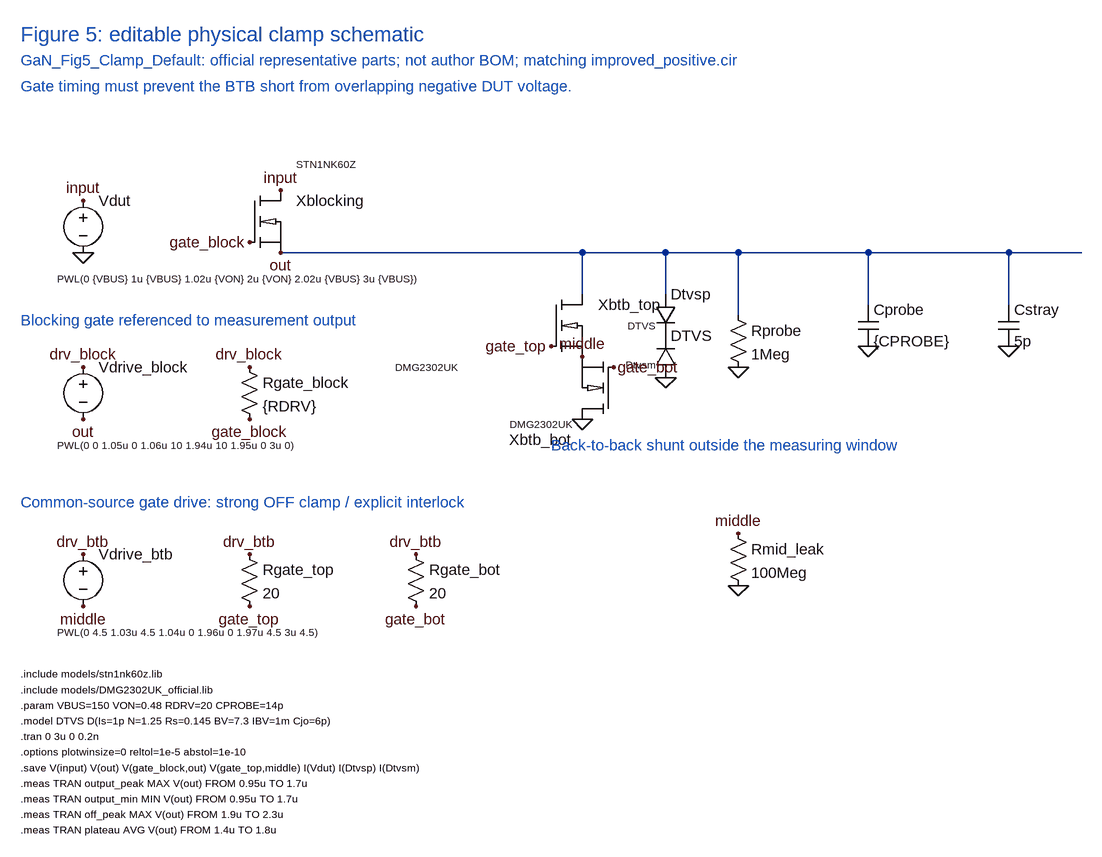
[diagram p0: schematic GaN_Fig5_Clamp_Default.asc]
GaN_Fig5_Clamp_Default.asc, the LTspice schematic file:
Version 4
SHEET 1 1880 1460
WIRE 1664 352 432 352
WIRE 896 416 896 352
WIRE 1024 416 1024 352
WIRE 1136 448 1136 352
WIRE 1336 432 1336 352
WIRE 1552 432 1552 352
FLAG 128 272 input
FLAG 128 352 0
FLAG 432 256 input
FLAG 384 336 gate_block
FLAG 432 352 out
FLAG 848 496 gate_top
FLAG 896 512 middle
FLAG 944 528 gate_bot
FLAG 896 608 0
FLAG 1024 544 0
FLAG 1136 528 0
FLAG 1336 496 0
FLAG 1552 496 0
FLAG 128 528 drv_block
FLAG 128 608 out
FLAG 384 528 drv_block
FLAG 384 608 gate_block
FLAG 128 816 drv_btb
FLAG 128 896 middle
FLAG 384 816 drv_btb
FLAG 384 896 gate_top
FLAG 640 816 drv_btb
FLAG 640 896 gate_bot
FLAG 1136 784 middle
FLAG 1136 864 0
SYMBOL voltage 128 256 R0
WINDOW 3 -40 136 Left 1
SYMATTR InstName Vdut
SYMATTR Value PWL(0 {VBUS} 1u {VBUS} 1.02u {VON} 2u {VON} 2.02u {VBUS} 3u {VBUS})
SYMBOL ClampBlockingSTN 384 256 R0
WINDOW 0 72 16 Left 2
WINDOW 3 72 -40 Left 1
SYMATTR InstName Xblocking
SYMATTR Value STN1NK60Z
SYMATTR Prefix X
SYMBOL ClampBTBDMG 848 416 R0
WINDOW 0 72 16 Left 2
WINDOW 3 -240 112 Left 1
SYMATTR InstName Xbtb_top
SYMATTR Value DMG2302UK
SYMATTR Prefix X
SYMBOL ClampBTBDMG 944 608 R180
WINDOW 0 64 -32 Left 2
WINDOW 3 64 -8 Left 1
SYMATTR InstName Xbtb_bot
SYMATTR Value DMG2302UK
SYMATTR Prefix X
SYMBOL diode 1008 416 R0
SYMATTR InstName Dtvsp
SYMATTR Value DTVS
SYMBOL diode 1040 544 R180
WINDOW 0 32 20 Left 1
WINDOW 3 32 80 Left 1
SYMATTR InstName Dtvsm
SYMATTR Value DTVS
SYMBOL res 1120 432 R0
SYMATTR InstName Rprobe
SYMATTR Value 1Meg
SYMBOL cap 1320 432 R0
SYMATTR InstName Cprobe
SYMATTR Value {CPROBE}
SYMBOL cap 1536 432 R0
SYMATTR InstName Cstray
SYMATTR Value 5p
SYMBOL voltage 128 512 R0
WINDOW 3 -40 136 Left 1
SYMATTR InstName Vdrive_block
SYMATTR Value PWL(0 0 1.05u 0 1.06u 10 1.94u 10 1.95u 0 3u 0)
SYMBOL res 368 512 R0
SYMATTR InstName Rgate_block
SYMATTR Value {RDRV}
SYMBOL voltage 128 800 R0
WINDOW 3 -40 136 Left 1
SYMATTR InstName Vdrive_btb
SYMATTR Value PWL(0 4.5 1.03u 4.5 1.04u 0 1.96u 0 1.97u 4.5 3u 4.5)
SYMBOL res 368 800 R0
SYMATTR InstName Rgate_top
SYMATTR Value 20
SYMBOL res 624 800 R0
SYMATTR InstName Rgate_bot
SYMATTR Value 20
SYMBOL res 1120 768 R0
SYMATTR InstName Rmid_leak
SYMATTR Value 100Meg
TEXT 32 16 Left 3 ;Figure 5: editable physical clamp schematic
TEXT 32 56 Left 2 ;GaN_Fig5_Clamp_Default: official representative parts; not author BOM; matching improved_positive.cir
TEXT 32 96 Left 2 ;Gate timing must prevent the BTB short from overlapping negative DUT voltage.
TEXT 848 648 Left 2 ;Back-to-back shunt outside the measuring window
TEXT 32 456 Left 2 ;Blocking gate referenced to measurement output
TEXT 32 736 Left 2 ;Common-source gate drive: strong OFF clamp / explicit interlock
TEXT 32 1000 Left 1 !.include models/stn1nk60z.lib
TEXT 32 1024 Left 1 !.include models/DMG2302UK_official.lib
TEXT 32 1048 Left 1 !.param VBUS=150 VON=0.48 RDRV=20 CPROBE=14p
TEXT 32 1072 Left 1 !.model DTVS D(Is=1p N=1.25 Rs=0.145 BV=7.3 IBV=1m Cjo=6p)
TEXT 32 1096 Left 1 !.tran 0 3u 0 0.2n
TEXT 32 1120 Left 1 !.options plotwinsize=0 reltol=1e-5 abstol=1e-10
TEXT 32 1144 Left 1 !.save V(input) V(out) V(gate_block,out) V(gate_top,middle) I(Vdut) I(Dtvsp) I(Dtvsm)
TEXT 32 1168 Left 1 !.meas TRAN output_peak MAX V(out) FROM 0.95u TO 1.7u
TEXT 32 1192 Left 1 !.meas TRAN output_min MIN V(out) FROM 0.95u TO 1.7u
TEXT 32 1216 Left 1 !.meas TRAN off_peak MAX V(out) FROM 1.9u TO 2.3u
TEXT 32 1240 Left 1 !.meas TRAN plateau AVG V(out) FROM 1.4u TO 1.8u

The netlist it stands for:
* GaN_Fig5_Clamp_Default.asc
Vdut input 0 PWL(0 {VBUS} 1u {VBUS} 1.02u {VON} 2u {VON} 2.02u {VBUS} 3u {VBUS})
XXblocking input gate_block out STN1NK60Z  ; pins D G S
XXbtb_top out gate_top middle DMG2302UK  ; pins D G S
XXbtb_bot 0 gate_bot middle DMG2302UK  ; pins D G S
Dtvsp out P001 DTVS
Dtvsm 0 P001 DTVS
Rprobe out 0 1Meg
Cprobe out 0 {CPROBE}
Cstray out 0 5p
Vdrive_block drv_block out PWL(0 0 1.05u 0 1.06u 10 1.94u 10 1.95u 0 3u 0)
Rgate_block drv_block gate_block {RDRV}
Vdrive_btb drv_btb middle PWL(0 4.5 1.03u 4.5 1.04u 0 1.96u 0 1.97u 4.5 3u 4.5)
Rgate_top drv_btb gate_top 20
Rgate_bot drv_btb gate_bot 20
Rmid_leak middle 0 100Meg
.model D D
.lib standard.dio
* Figure 5: editable physical clamp schematic
* GaN_Fig5_Clamp_Default: official representative parts; not author BOM; matching improved_positive.cir
* Gate timing must prevent the BTB short from overlapping negative DUT voltage.
* Back-to-back shunt outside the measuring window
* Blocking gate referenced to measurement output
* Common-source gate drive: strong OFF clamp / explicit interlock
.include models/stn1nk60z.lib
.include models/DMG2302UK_official.lib
.param VBUS=150 VON=0.48 RDRV=20 CPROBE=14p
.model DTVS D(Is=1p N=1.25 Rs=0.145 BV=7.3 IBV=1m Cjo=6p)
.tran 0 3u 0 0.2n
.options plotwinsize=0 reltol=1e-5 abstol=1e-10
.save V(input) V(out) V(gate_block,out) V(gate_top,middle) I(Vdut) I(Dtvsp) I(Dtvsm)
.meas TRAN output_peak MAX V(out) FROM 0.95u TO 1.7u
.meas TRAN output_min MIN V(out) FROM 0.95u TO 1.7u
.meas TRAN off_peak MAX V(out) FROM 1.9u TO 2.3u
.meas TRAN plateau AVG V(out) FROM 1.4u TO 1.8u
.backanno
.end